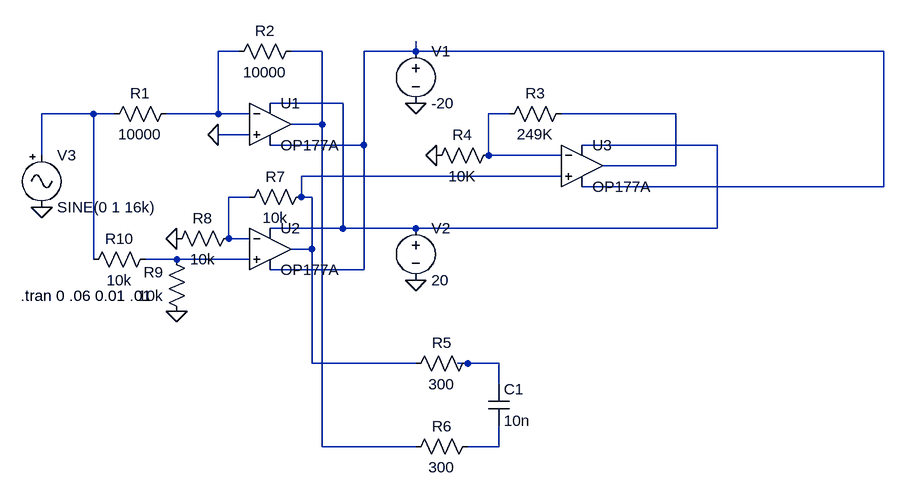
[diagram p0: schematic mic_op_amps.asc]
mic_op_amps.asc, the LTspice schematic file:
Version 4
SHEET 1 1156 680
WIRE 160 -16 128 -16
WIRE 288 -16 240 -16
WIRE 432 -16 432 -32
WIRE 432 -16 352 -16
WIRE 1152 -16 432 -16
WIRE 320 64 208 64
WIRE -64 80 -144 80
WIRE -32 80 -64 80
WIRE 128 80 128 -16
WIRE 128 80 48 80
WIRE 176 80 128 80
WIRE 576 80 544 80
WIRE 832 80 656 80
WIRE 288 96 288 -16
WIRE 288 96 240 96
WIRE 176 112 128 112
WIRE 352 128 352 -16
WIRE 352 128 208 128
WIRE 896 128 688 128
WIRE -144 144 -144 80
WIRE 544 144 544 80
WIRE 656 144 544 144
WIRE 832 160 832 80
WIRE 832 160 720 160
WIRE 656 176 256 176
WIRE 1152 192 1152 -16
WIRE 1152 192 688 192
WIRE 176 208 144 208
WIRE 256 208 256 176
WIRE 272 208 256 208
WIRE 320 256 320 64
WIRE 320 256 208 256
WIRE 432 256 320 256
WIRE 896 256 896 128
WIRE 896 256 432 256
WIRE 144 272 144 208
WIRE 176 272 144 272
WIRE 272 288 272 208
WIRE 272 288 240 288
WIRE -64 304 -64 80
WIRE 64 304 16 304
WIRE 176 304 64 304
WIRE 352 320 352 128
WIRE 352 320 208 320
WIRE 272 464 272 288
WIRE 432 464 272 464
WIRE 512 464 496 464
WIRE 560 464 512 464
WIRE 560 496 560 464
WIRE 288 592 288 96
WIRE 432 592 288 592
WIRE 560 592 560 560
WIRE 560 592 512 592
FLAG 128 112 0
FLAG 432 336 0
FLAG 432 64 0
FLAG -144 224 0
FLAG 464 144 0
FLAG 64 384 0
FLAG 64 272 0
SYMBOL OpAmps\\OP177A 208 32 R0
SYMATTR InstName U1
SYMBOL OpAmps\\OP177A 208 224 R0
SYMATTR InstName U2
SYMBOL voltage 432 -32 R0
WINDOW 123 0 0 Left 0
WINDOW 39 0 0 Left 0
SYMATTR InstName V1
SYMATTR Value -20
SYMBOL voltage 432 240 R0
WINDOW 123 0 0 Left 0
WINDOW 39 0 0 Left 0
SYMATTR InstName V2
SYMATTR Value 20
SYMBOL Misc\\signal -144 128 R0
WINDOW 123 0 0 Left 0
WINDOW 39 0 0 Left 0
SYMATTR InstName V3
SYMATTR Value SINE(0 1 16k)
SYMBOL res 64 64 R90
WINDOW 0 0 56 VBottom 2
WINDOW 3 32 56 VTop 2
SYMATTR InstName R1
SYMATTR Value 10000
SYMBOL res 256 -32 R90
WINDOW 0 0 56 VBottom 2
WINDOW 3 32 56 VTop 2
SYMATTR InstName R2
SYMATTR Value 10000
SYMBOL OpAmps\\OP177A 688 96 R0
SYMATTR InstName U3
SYMBOL res 672 64 R90
WINDOW 0 0 56 VBottom 2
WINDOW 3 32 56 VTop 2
SYMATTR InstName R3
SYMATTR Value 249K
SYMBOL res 448 160 R270
WINDOW 0 32 56 VTop 2
WINDOW 3 0 56 VBottom 2
SYMATTR InstName R4
SYMATTR Value 10K
SYMBOL res 528 448 R90
WINDOW 0 0 56 VBottom 2
WINDOW 3 32 56 VTop 2
SYMATTR InstName R5
SYMATTR Value 300
SYMBOL res 528 576 R90
WINDOW 0 0 56 VBottom 2
WINDOW 3 32 56 VTop 2
SYMATTR InstName R6
SYMATTR Value 300
SYMBOL cap 544 496 R0
SYMATTR InstName C1
SYMATTR Value 10n
SYMBOL res 272 192 R90
WINDOW 0 0 56 VBottom 2
WINDOW 3 32 56 VTop 2
SYMATTR InstName R7
SYMATTR Value 10k
SYMBOL res 160 256 R90
WINDOW 0 0 56 VBottom 2
WINDOW 3 32 56 VTop 2
SYMATTR InstName R8
SYMATTR Value 10k
SYMBOL res 80 400 R180
WINDOW 0 36 76 Left 2
WINDOW 3 36 40 Left 2
SYMATTR InstName R9
SYMATTR Value 10k
SYMBOL res -80 320 R270
WINDOW 0 32 56 VTop 2
WINDOW 3 0 56 VBottom 2
SYMATTR InstName R10
SYMATTR Value 10k
TEXT -176 360 Left 2 !.tran 0 .06 0.01 .01

The netlist it stands for:
* mic_op_amps.asc
XU1 0 N001 N004 N003 N002 OP177A  ; pins In+ In- V+ V- OUT
XU2 N010 N009 N004 N003 N008 OP177A  ; pins In+ In- V+ V- OUT
V1 N003 0 -20
V2 N004 0 20
V3 N005 0 SINE(0 1 16k)
R1 N001 N005 10000
R2 N002 N001 10000
XU3 N008 N006 N004 N003 N007 OP177A  ; pins In+ In- V+ V- OUT
R3 N007 N006 249K
R4 0 N006 10K
R5 N011 N008 300
R6 N012 N002 300
C1 N011 N012 10n
R7 N008 N009 10k
R8 N009 0 10k
R9 0 N010 10k
R10 N005 N010 10k
.tran 0 .06 0.01 .01
.backanno
.end